# Altium project OpenRex_V1I1.PrjPcb (part 12 of 15)

## Sheet [23] - SENSORS, CAN, IR.SchDoc
size A2; DocumentNumber: 23; SheetNumber: 23; SheetTotal: 31
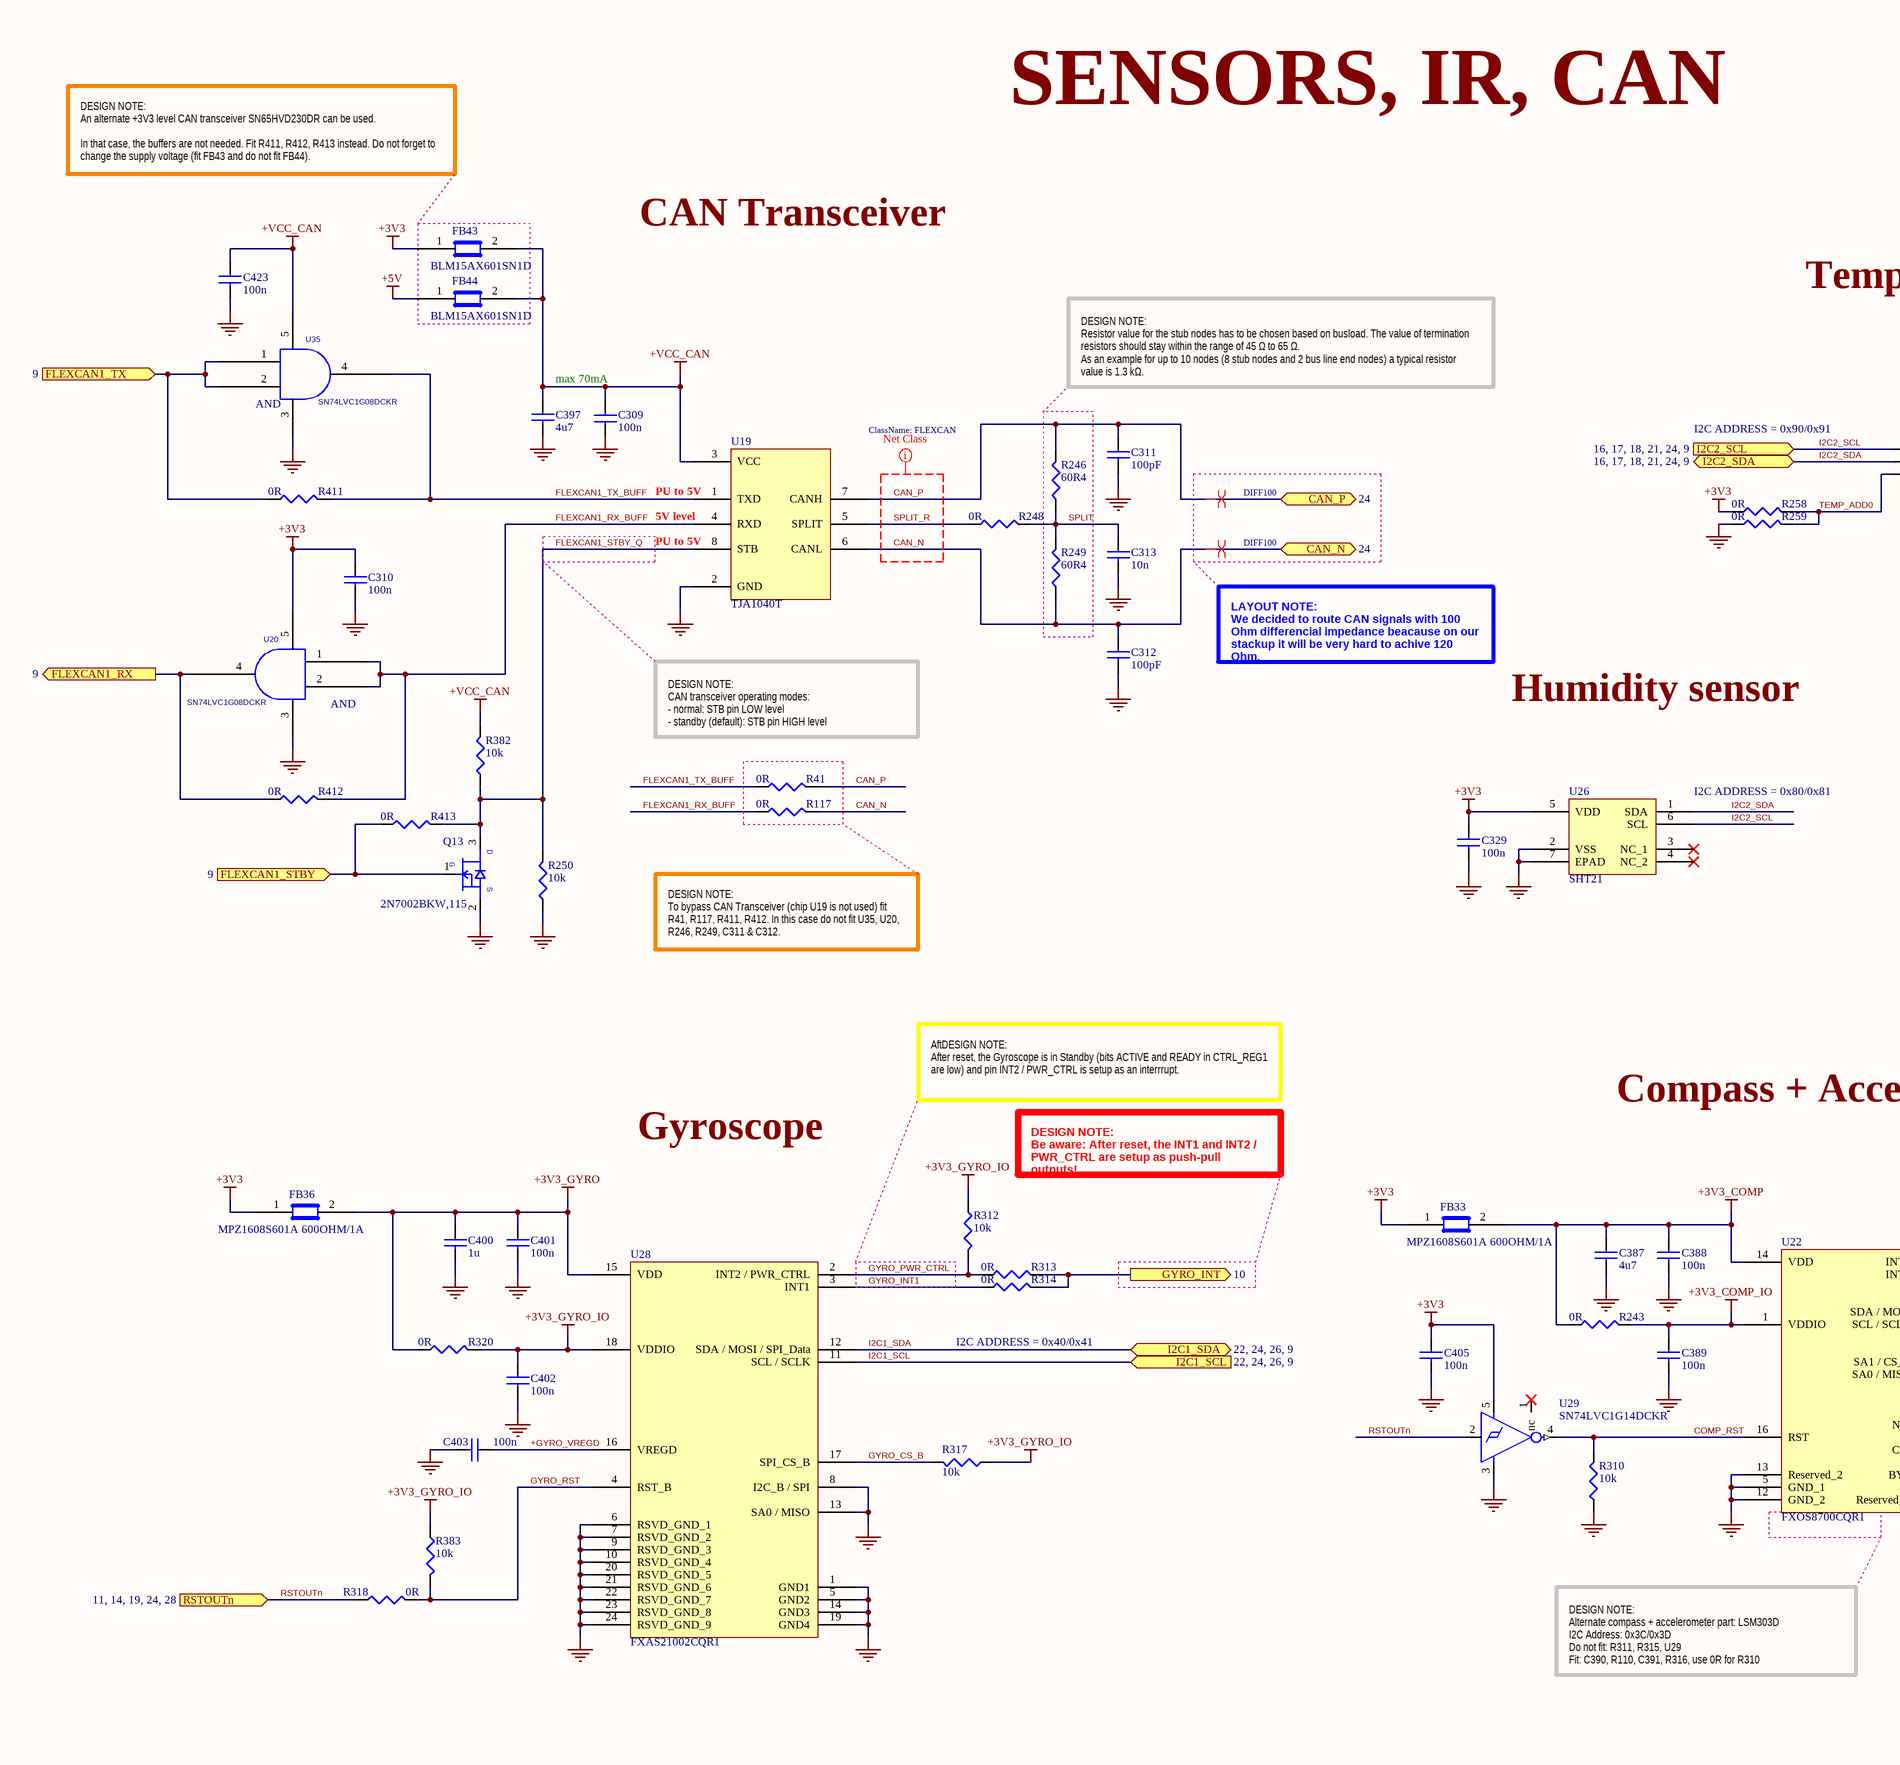
[diagram p44: [23] - SENSORS, CAN, IR.SchDoc, left]
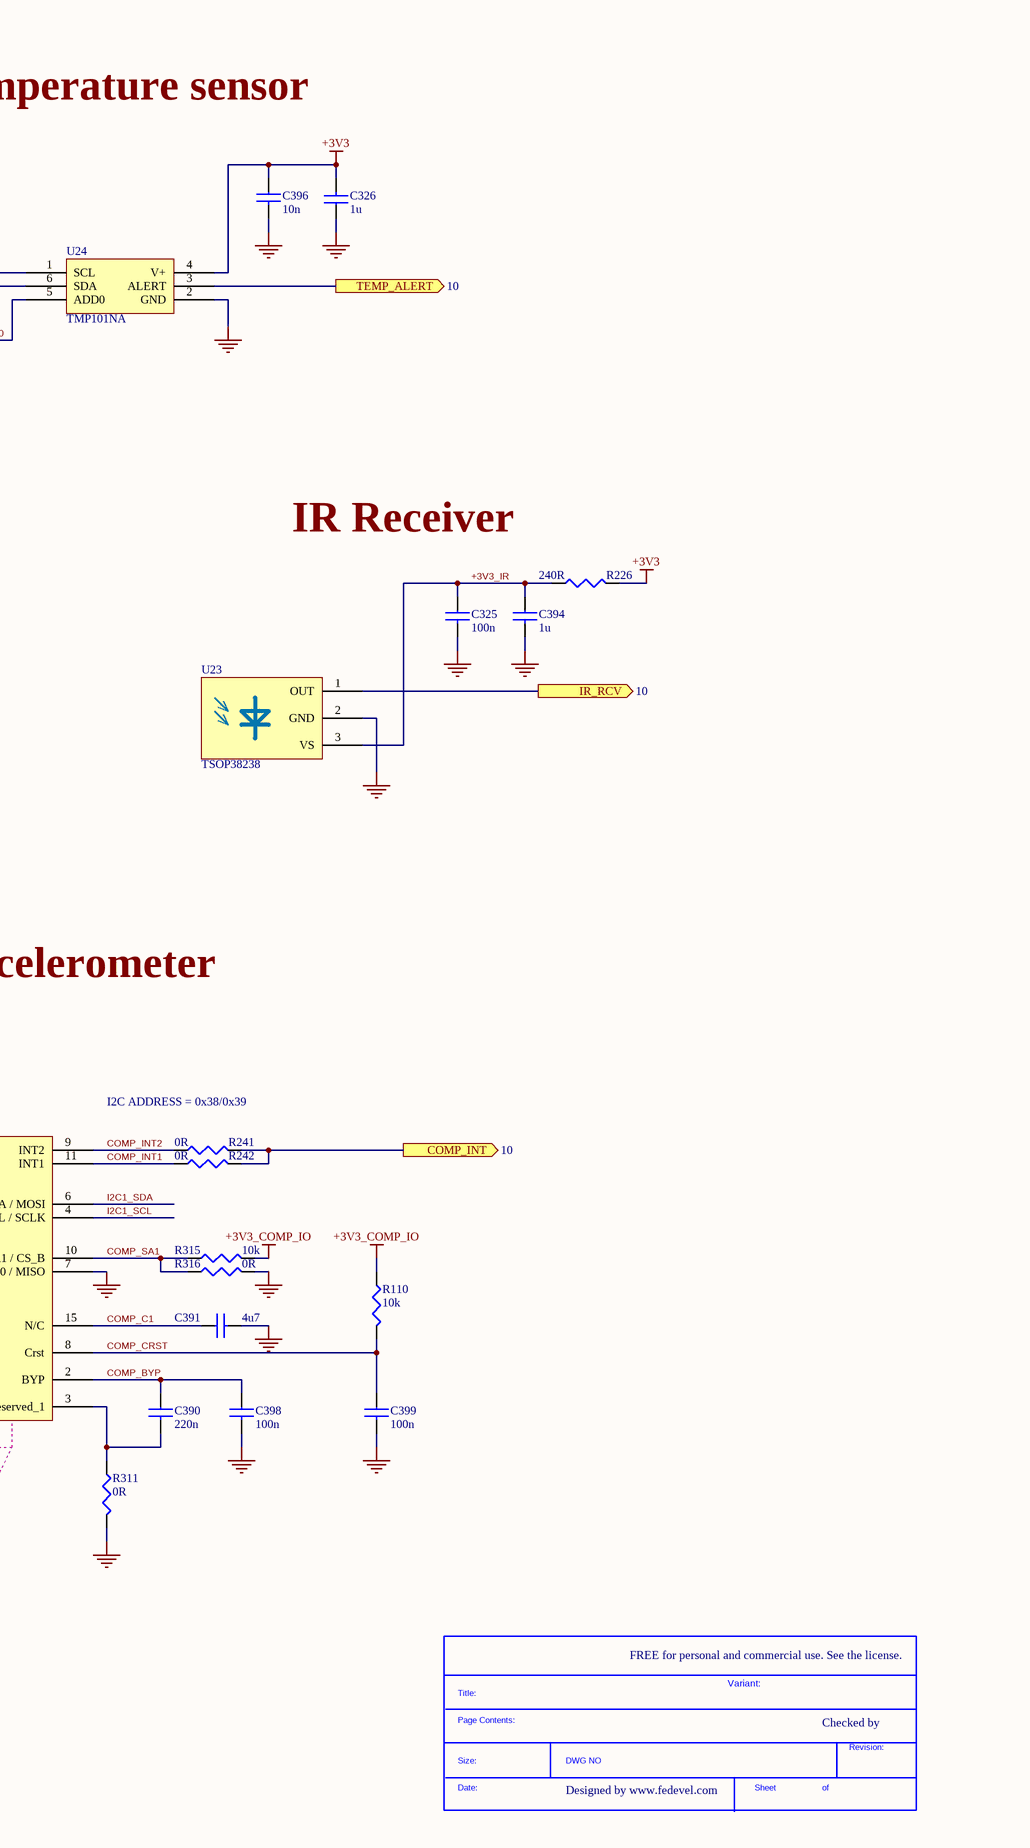
[diagram p45: [23] - SENSORS, CAN, IR.SchDoc, right]

### Parts
(Parts that share a designator on the sheet are numbered #1, #2 ... from top to bottom, then left to right.)
*#26  SDTitleBlock  (value not drawn)  (graphical)
C309  100n  [C0402]
C310  100n  [C0402]
C311  100pF  [C0402]
C312  100pF  [C0402]
C313  10n  [C0402]
C325  100n  [C0402]
C326  1u  [C0402]
C329  100n  [C0402]
C387  4u7  [C0402]
C388  100n  [C0402]
C389  100n  [C0402]
C390  220n  [C0402]
C391  4u7  [C0402]
C394  1u  [C0402]
C396  10n  [C0402]
C397  4u7  [C0402]
C398  100n  [C0402]
C399  100n  [C0402]
C400  1u  [C0402]
C401  100n  [C0402]
C402  100n  [C0402]
C403  100n  [C0402]
C405  100n  [C0402]
C423  100n  [C0402]
FB33  MPZ1608S601A 600OHM/1A  [C0603]
FB36  MPZ1608S601A 600OHM/1A  [C0603]
FB43  BLM15AX601SN1D  [C0402]
FB44  BLM15AX601SN1D  [C0402]
Q13  2N7002BKW,115  [SC70_SOT323]
R41  0R  [R0402]
R110  10k  [R0402]
R117  0R  [R0402]
R226  240R  [R0402]
R241  0R  [R0402]
R242  0R  [R0402]
R243  0R  [R0402]
R246  60R4  [R0402]
R248  0R  [R0402]
R249  60R4  [R0402]
R250  10k  [R0402]
R258  0R  [R0402]
R259  0R  [R0402]
R310  10k  [R0402]
R311  0R  [R0402]
R312  10k  [R0402]
R313  0R  [R0402]
R314  0R  [R0402]
R315  10k  [R0402]
R316  0R  [R0402]
R317  10k  [R0402]
R318  0R  [R0402]
R320  0R  [R0402]
R382  10k  [R0402]
R383  10k  [R0402]
R411  0R  [R0402]
R412  0R  [R0402]
R413  0R  [R0402]
U19  TJA1040T  [8_SOIC_3.9MM]
U20  SN74LVC1G08DCKR  [SC70_5]
U22  FXOS8700CQR1  [QFN16_3x3mm]
U23  TSOP38238  [TSOP382]
U24  TMP101NA  [SOT23-6_DBV6]
U26  SHT21  [6_DFN_3mmx3mm]
U28  FXAS21002CQR1  [QFN24_4x4MM]
U29  SN74LVC1G14DCKR  [SC70_5]
U35  SN74LVC1G08DCKR  [SC70_5]

### Ports
CAN_N (bidir, see 24), CAN_P (bidir, see 24), COMP_INT (out, see 10), FLEXCAN1_RX (out, see 9), FLEXCAN1_STBY (in, see 9), FLEXCAN1_TX (in, see 9), GYRO_INT (out, see 10), I2C1_SCL (see 22, 24, 26, 9), I2C1_SDA (bidir, see 22, 24, 26, 9), I2C2_SCL (see 16, 17, 18, 21, 24, 9), I2C2_SDA (bidir, see 16, 17, 18, 21, 24, 9), IR_RCV (out, see 10), RSTOUTn (see 11, 14, 19, 24, 28), TEMP_ALERT (out, see 10)

### Nets
+3V3: C310.1 C326.2 C329.1 C396.1 C405.1 FB33.1 FB36.1 FB43.1 R226.2 R258.1 U20.5(VCC) U24.4(V+) U26.5(VDD) U29.5(NC1)
+3V3_COMP: C387.1 C388.1 FB33.2 R243.1 U22.14(VDD)
+3V3_COMP_IO: C389.1 R110.1 R243.2 R315.2 U22.1(VDDIO)
+3V3_GYRO: C400.1 C401.1 FB36.2 R320.1 U28.15(VDD)
+3V3_GYRO_IO: C402.1 R312.1 R317.1 R320.2 R383.1 U28.18(VDDIO)
+5V: FB44.1
+VCC_CAN: C309.2 C397.1 C423.1 FB43.2 FB44.2 R382.2 U19.3(VCC) U35.5(VCC)
GND: C309.1 C310.2 C311.2 C312.2 C313.2 C325.2 C326.1 C329.2 C387.2 C388.2 C389.2 C391.2 C394.2 C396.2 C397.2 C398.2 C399.2 C400.2 C401.2 C402.2 C403.2 C405.2 C423.2 Q13.2(SOURCE) R250.1 R259.1 R310.1 R311.2 R316.2 U19.2(GND) U20.3(GND) U22.5(GND_1) U22.7(SA0_/_MISO) U22.12(GND_2) U22.13(Reserved_2) U23.2(GND) U24.2(GND) U26.2(VSS) U26.7(EPAD) U28.1(GND1) U28.5(GND2) U28.6(RSVD_GND_1) U28.7(RSVD_GND_2) U28.8(I2C_B_/_SPI) U28.9(RSVD_GND_3) U28.10(RSVD_GND_4) U28.13(SA0_/_MISO) U28.14(GND3) U28.19(GND4) U28.20(RSVD_GND_5) U28.21(RSVD_GND_6) U28.22(RSVD_GND_7) U28.23(RSVD_GND_8) U28.24(RSVD_GND_9) U29.3(GND) U35.3(GND)
+3V3_IR: C325.1 C394.1 R226.1 U23.3(VS)
+GYRO_VREGD: C403.1 U28.16(VREGD)
CAN_N: C312.1 R117.2 R249.1 U19.6(CANL) ; port CAN_N
CAN_P: C311.1 R41.2 R246.2 U19.7(CANH) ; port CAN_P
COMP_BYP: C390.1 C398.1 U22.2(BYP)
COMP_C1: C391.1 U22.15(N/C)
COMP_CRST: C399.1 R110.2 U22.8(Crst)
COMP_INT: R241.2 R242.2 ; port COMP_INT
COMP_INT1: R242.1 U22.11(INT1)
COMP_INT2: R241.1 U22.9(INT2)
COMP_RST: R310.2 U22.16(RST) U29.4(O)
COMP_SA1: R315.1 R316.1 U22.10(SA1_/_CS_B)
FLEXCAN1_RX: R412.1 U20.4(Y) ; port FLEXCAN1_RX
FLEXCAN1_RX_BUFF: R117.1 R412.2 U19.4(RXD) U20.1(A) U20.2(B)
FLEXCAN1_STBY: Q13.1(GATE) R413.1 ; port FLEXCAN1_STBY
FLEXCAN1_STBY_Q: Q13.3(DRAIN) R250.2 R382.1 R413.2 U19.8(STB)
FLEXCAN1_TX: R411.1 U35.1(A) U35.2(B) ; port FLEXCAN1_TX
FLEXCAN1_TX_BUFF: R41.1 R411.2 U19.1(TXD) U35.4(Y)
GYRO_CS_B: R317.2 U28.17(SPI_CS_B)
GYRO_INT: R313.2 R314.2 ; port GYRO_INT
GYRO_INT1: R314.1 U28.3(INT1)
GYRO_PWR_CTRL: R312.2 R313.1 U28.2(INT2_/_PWR_CTRL)
GYRO_RST: R318.2 R383.2 U28.4(RST_B)
I2C1_SCL: U22.4(SCL_/_SCLK) U28.11(SCL_/_SCLK) ; port I2C1_SCL
I2C1_SDA: U22.6(SDA_/_MOSI) U28.12(SDA_/_MOSI_/_SPI_Data) ; port I2C1_SDA
I2C2_SCL: U24.1(SCL) U26.6(SCL) ; port I2C2_SCL
I2C2_SDA: U24.6(SDA) U26.1(SDA) ; port I2C2_SDA
IR_RCV: U23.1(OUT) ; port IR_RCV
RSTOUTn: R318.1 U29.2(I) ; port RSTOUTn
SPLIT: C313.1 R246.1 R248.2 R249.2
SPLIT_R: R248.1 U19.5(SPLIT)
TEMP_ADD0: R258.2 R259.2 U24.5(ADD0)
TEMP_ALERT: U24.3(ALERT) ; port TEMP_ALERT
NetC390_2: C390.2 R311.1 U22.3(Reserved_1)

Not connected (* = marked no-connect by the designer): U26 3(NC_1)* 4(NC_2)*; U29 1(nc)*

### Layout directives
net class FLEXCAN: CAN_N, CAN_P, SPLIT_R
differential pair; net class DIFF100: CAN_N, CAN_P

### Notes on the sheet
- SENSORS, IR, CAN
- DESIGN NOTE:
  An alternate +3V3 level CAN transceiver SN65HVD230DR can be used.
  In that case, the buffers are not needed. Fit R411, R412, R413 instead. Do not forget to change the supply voltage (fit FB43 and do not fit FB44).
- CAN Transceiver
- Temperature sensor
- max 70mA
- DESIGN NOTE:
  Resistor value for the stub nodes has to be chosen based on busload. The value of termination resistors should stay within the range of 45 Ω to 65 Ω.
  As an example for up to 10 nodes (8 stub nodes and 2 bus line end nodes) a typical resistor value is 1.3 kΩ.
- I2C ADDRESS = 0x90/0x91
- (near U19) PU to 5V
- (near U19) 5V level
- LAYOUT NOTE:
  We decided to route CAN signals with 100 Ohm differencial impedance beacause on our stackup it will be very hard to achive 120 Ohm.
- DESIGN NOTE:
  CAN transceiver operating modes:
  - normal: STB pin LOW level
  - standby (default): STB pin HIGH level
- Humidity sensor
- IR Receiver
- (near U26) I2C ADDRESS = 0x80/0x81
- DESIGN NOTE:
  To bypass CAN Transceiver (chip U19 is not used) fit R41, R117, R411, R412. In this case do not fit U35, U20, R246, R249, C311 & C312.
- AftDESIGN NOTE:
  After reset, the Gyroscope is in Standby (bits ACTIVE and READY in CTRL_REG1 are low) and pin INT2 / PWR_CTRL is setup as an interrrupt.
- Compass + Accelerometer
- Gyroscope
- DESIGN NOTE:
  Be aware: After reset, the INT1 and INT2 / PWR_CTRL are setup as push-pull outputs!
- I2C ADDRESS = 0x38/0x39
- I2C ADDRESS = 0x40/0x41
- DESIGN NOTE:
  Alternate compass + accelerometer part: LSM303D
  I2C Address: 0x3C/0x3D
  Do not fit: R311, R315, U29
  Fit: C390, R110, C391, R316, use 0R for R310
- FREE for personal and commercial use. See the license.
- Variant:
- Checked by
- Designed by www.fedevel.com
- (in symbol 2N7002BKW,115) D; G; S
- (in symbol SDTitleBlock) Title:; Page Contents:; Revision:; Size:; DWG NO; Date:; Sheet; of
- (in symbol SN74LVC1G08DCKR) AND

### Library data of the parts
C309 C310 C325 C329 C388 C389 C398 C399 C401-C403 C405 C423 = C1005X5R1H104K: as C230 on sheet [28] - PWR IN, MECH, DOC; Category: Capacitors; Supplier Part Number: 445-5942-1-ND; Manufacturer Part Number: C1005X5R1H104K; Operating Temperature: -55°C ~ 85°C; Package / Case: 0402 (1005 Metric); Price 1k [$]: 0.02340; .Checked SCH: used; Voltage - Rated: 50V; Supplier: Digikey; Supplier 1: Digi-Key; Supplier Part Number 1: 445-5942-1-ND; RoHS: RoHS Compliant; Stock 1: 106926; Pricing 1: 1=0.27, 10=0.18, 100=0.072, 250=0.05176, 500=0.0369, 1000=0.027 (USD); Tolerance: ±10%; Temperature Coefficient: X5R; Mounting Type: Surface Mount, MLCC; Applications: General Purpose; Ratings: -; Size / Dimension: 0.039" L x 0.020" W (1.00mm x 0.50mm); Height - Seated (Max): -; Thickness (Max): 0.022" (0.55mm); Lead Spacing: -; Features: -; Packaging: Cut Tape (CT); Lead Style: -; ComponentLink1URL: http://www.tdk.co.jp/tefe02/e412_c.pdf; ComponentLink1Description: http://www.tdk.co.jp/tefe02/e412_c.pdf
C311 C312 = C1005C0G1H101J: CAP CER 100PF 50V 5% NP0 0402; Manufacturer: TDK Corporation; Temperature Coefficient: C0G, NP0; .Checked PCB: used; Supplier 1: Digi-Key; Supplier Part Number 1: 445-1247-1-ND; Manufacturer Part Number: C1005C0G1H101J; RoHS: RoHS Compliant; Category: Capacitors; Stock 1: 298233; Pricing 1: 1=0.08, 10=0.05, 100=0.018, 250=0.013, 500=0.0096, 1000=0.0065 (USD); Capacitance: 100pF; Voltage - Rated: 50V; Tolerance: ±5%; Mounting Type: Surface Mount, MLCC; Operating Temperature: -55°C ~ 125°C; Applications: General Purpose; Ratings: -; Package / Case: 0402 (1005 Metric); Size / Dimension: 0.039" L x 0.020" W (1.00mm x 0.50mm); Height - Seated (Max): -; Thickness (Max): 0.022" (0.55mm); Lead Spacing: -; Features: -; Packaging: Cut Tape (CT); Lead Style: -; ComponentLink1URL: http://www.tdk.com/pdf/general_B11.pdf; ComponentLink1Description: http://www.tdk.com/pdf/general_B11.pdf; .Checked SCH: used
C313 C396 = C1005X7R1H103K: CAP CER 10000PF 50V 10% X7R 0402; Manufacturer: TDK Corporation; Value: 10nF; .Checked PCB: used; Capacitance: 10000pF; Category: Capacitors; Supplier Part Number: 445-6850-1-ND; Manufacturer Part Number: C1005X7R1H103K; Operating Temperature: -55°C ~ 125°C; Package / Case: 0402 (1005 Metric); Price 1k [$]: 0.01625; .Checked SCH: used; Voltage - Rated: 50V; Supplier: Digikey; Supplier 1: Digi-Key; Supplier Part Number 1: 445-6850-1-ND; RoHS: RoHS Compliant; Stock 1: 3901; Pricing 1: 1=0.2, 10=0.125, 100=0.045, 250=0.03252, 500=0.024, 1000=0.01625 (USD); Tolerance: ±10%; Temperature Coefficient: X7R; Mounting Type: Surface Mount, MLCC; Applications: General Purpose; Ratings: -; Size / Dimension: 0.039" L x 0.020" W (1.00mm x 0.50mm); Height - Seated (Max): -; Thickness (Max): 0.022" (0.55mm); Lead Spacing: -; Features: -; Packaging: Cut Tape (CT); Lead Style: -; ComponentLink1URL: http://www.tdk.co.jp/tefe02/e412_c.pdf; ComponentLink1Description: http://www.tdk.co.jp/tefe02/e412_c.pdf
C326 C394 C400 = C1005X5R1C105K: CAP CER 1.0UF 16V X5R 0402; Manufacturer: TDK Corporation; Capacitance: 1.0µF; Value: 1uF; .Checked PCB: used; Tolerance: ±10%; Category: Capacitors; Supplier Part Number: 445-4978-1-ND; Manufacturer Part Number: C1005X5R1C105K; Operating Temperature: -55°C ~ 85°C; Package / Case: 0402 (1005 Metric); Price 1k [$]: 0.02080; .Checked SCH: used; Voltage - Rated: 16V; Supplier: Digikey; Supplier 1: Digi-Key; Supplier Part Number 1: 445-4978-1-ND; RoHS: RoHS Compliant; Stock 1: 341010; Pricing 1: 1=0.24, 10=0.16, 100=0.064, 250=0.046, 500=0.0328, 1000=0.024 (USD); Temperature Coefficient: X5R; Mounting Type: Surface Mount, MLCC; Applications: General Purpose; Ratings: -; Size / Dimension: 0.039" L x 0.020" W (1.00mm x 0.50mm); Height - Seated (Max): -; Thickness (Max): 0.022" (0.55mm); Lead Spacing: -; Features: -; Packaging: Cut Tape (CT); Lead Style: -; ComponentLink1URL: http://www.tdk.co.jp/tefe02/e412_c.pdf; ComponentLink1Description: http://www.tdk.co.jp/tefe02/e412_c.pdf
C387 C391 C397 = C1005X5R1A475M: CAP CER 4.7UF 10V 20% X5R 0402; Manufacturer: TDK Corporation; Capacitance: 4.7µF; .Checked PCB: used; Supplier 1: Digi-Key; Supplier Part Number 1: 445-8023-1-ND; Manufacturer Part Number: C1005X5R1A475M; RoHS: RoHS Compliant; Category: Capacitors; Stock 1: 10140; Pricing 1: 1=0.53, 10=0.415, 100=0.25, 250=0.18752, 500=0.16, 1000=0.125, 5000=0.095 (USD); Voltage - Rated: 10V; Tolerance: ±20%; Temperature Coefficient: X5R; Mounting Type: Surface Mount, MLCC; Operating Temperature: -55°C ~ 85°C; Applications: General Purpose; Ratings: -; Package / Case: 0402 (1005 Metric); Size / Dimension: 0.039" L x 0.020" W (1.00mm x 0.50mm); Height - Seated (Max): -; Thickness (Max): -; Lead Spacing: -; Features: -; Packaging: Cut Tape (CT); Lead Style: -; ComponentLink1URL: http://www.tdk.com/pdf/general_B11.pdf; ComponentLink1Description: http://www.tdk.com/pdf/general_B11.pdf; .Checked SCH: used
C390 = C1005X5R1E224M: CAP CER .22UF 25V X5R 20% 0402; Manufacturer: TDK Corporation; Capacitance: 0.22µF; Value: 220nF; .Checked PCB: used; Category: Capacitors; Supplier Part Number: 445-5945-1-ND; Manufacturer Part Number: C1005X5R1E224M; Operating Temperature: -55°C ~ 85°C; Package / Case: 0402 (1005 Metric); Price 1k [$]: 0.02600; .Checked SCH: used; Voltage - Rated: 25V; Supplier: Digikey; Supplier 1: Digi-Key; Supplier Part Number 1: 445-5945-1-ND; RoHS: RoHS Compliant; Stock 1: 54593; Pricing 1: 1=0.3, 10=0.2, 100=0.08, 250=0.05752, 500=0.041, 1000=0.03 (USD); Tolerance: ±20%; Temperature Coefficient: X5R; Mounting Type: Surface Mount, MLCC; Applications: General Purpose; Ratings: -; Size / Dimension: 0.039" L x 0.020" W (1.00mm x 0.50mm); Height - Seated (Max): -; Thickness (Max): 0.022" (0.55mm); Lead Spacing: -; Features: -; Packaging: Cut Tape (CT); Lead Style: -; ComponentLink1URL: http://www.tdk.co.jp/tefe02/e412_c.pdf; ComponentLink1Description: http://www.tdk.co.jp/tefe02/e412_c.pdf
FB33 FB36 = MPZ1608S601A: FERRITE CHIP BEAD 600 OHM SMD 1A; Manufacturer: TDK Corporation; Impedance @ Frequency: 600 Ohm @ 100MHz; DC Resistance (DCR): 150 mOhm Max; Filter Type: Differential Mode - Single; Number of Lines: 1; .Checked PCB: used; Supplier 1: Digi-Key; Supplier Part Number 1: 445-2205-1-ND; Manufacturer Part Number: MPZ1608S601A; RoHS: RoHS Compliant; Category: Filters; Stock 1: 328345; Pricing 1: 1=0.36, 10=0.24, 100=0.096, 250=0.069, 500=0.0492, 1000=0.036 (USD); Current Rating: 1A; Package / Case: 0603 (1608 Metric); Mounting Type: Surface Mount; Packaging: Cut Tape (CT); Height (Max): 0.037" (0.95mm); Size / Dimension: 0.063" L x 0.031" W (1.60mm x 0.80mm); ComponentLink1URL: http://www.tdk.co.jp/tefe02/e9413_mpz.pdf; ComponentLink1Description: http://www.tdk.co.jp/tefe02/e9413_mpz.pdf; .Checked SCH: used
FB43 FB44 = BLM15AX601SN1D: FERRITE CHIP 600 OHM 0402 420mA; Manufacturer: Murata Electronics North America; .Checked PCB: used; Impedance @ Frequency: 600 Ohm @ 100MHz; DC Resistance (DCR): 340 mOhm Max; Filter Type: Differential Mode - Single; Number of Lines: 1; .Checked SCH: used; Category: Filters; Supplier Part Number: 490-5441-1-ND; Manufacturer Part Number: BLM15AX601SN1D; Package / Case: 0402 (1005 Metric); Price 1k [$]: 0.03280; Value: BLM15AX601SN1D; Current Rating: 420mA; Supplier: Digikey; Supplier 1: Digi-Key; Supplier Part Number 1: 490-5441-1-ND; RoHS: RoHS Compliant; Stock 1: 34008; Pricing 1: 1=0.26, 10=0.197, 50=0.1148, 100=0.0918, 250=0.0656, 500=0.0446, 1000=0.03608, 5000=0.02821 (USD); Mounting Type: Surface Mount; Packaging: Cut Tape (CT); Height (Max): 0.022" (0.55mm); Size / Dimension: 0.039" L x 0.020" W (1.00mm x 0.50mm); ComponentLink1URL: http://search.murata.co.jp/Ceramy/image/img/PDF/ENG/L0110S0100BLM15AX_SN.pdf; ComponentLink1Description: http://search.murata.co.jp/Ceramy/image/img/PDF/ENG/L0110S0100BLM15AX_SN.pdf
Q13 = 2N7002BKW,115: as Q3 on sheet [22] - SD CARD, SPI, FLASH, EEPROM,; Supplier 1: Digi-Key; Supplier Part Number 1: 568-5980-1-ND; Manufacturer Part Number: 2N7002BKW,115; RoHS: RoHS Compliant; Category: Discrete Semiconductor Products; Stock 1: 15666; Pricing 1: 1=0.39, 10=0.354, 25=0.2548, 100=0.1983, 250=0.12456, 500=0.10616, 1000=0.07233 (USD); Drain to Source Voltage (Vdss): 60V; Current - Continuous Drain (Id) @ 25° C: 310mA; Mounting Type: Surface Mount; Package / Case: SC-70, SOT-323; Supplier Device Package: SC-70; Packaging: Cut Tape (CT); ComponentLink1URL: http://www.nxp.com/documents/data_sheet/2N7002BKW.pdf; ComponentLink1Description: http://www.nxp.com/documents/data_sheet/2N7002BKW.pdf; .Checked SCH: used
R41 R117 R241-R243 R248 R258 R259 R311 R313 R314 R316 R318 R320 R411-R413 = RC0402JR-070RL: as R155 on sheet [28] - PWR IN, MECH, DOC; Category: Resistors; Supplier Part Number: 311-0.0JRCT-ND; Manufacturer Part Number: RC0402JR-070RL; Package / Case: 0402 (1005 Metric); Price 1k [$]: 0.01389; Value: 0R; .Checked SCH: used; Supplier: Digikey; Supplier 1: Digi-Key; Supplier Part Number 1: 311-0.0JRCT-ND; RoHS: RoHS Compliant; Stock 1: 1106330; Pricing 1: 10=0.012, 50=0.009, 100=0.0069, 250=0.00512, 500=0.0038, 1000=0.00253 (USD); Composition: Thick Film; Features: -; Temperature Coefficient: -; Size / Dimension: 0.039" L x 0.020" W (1.00mm x 0.50mm); Height: 0.016" (0.40mm); Number of Terminations: 2; Packaging: Cut Tape (CT); ComponentLink1URL: http://www.yageo.com/documents/recent/PYu-RC0402_51_RoHS_L_6.pdf; ComponentLink1Description: http://www.yageo.com/documents/recent/PYu-RC0402_51_RoHS_L_6.pdf
R110 R250 R310 R312 R315 R317 R382 R383 = RC0402FR-0710KL: as R174 on sheet [28] - PWR IN, MECH, DOC; Category: Resistors; Manufacturer Part Number: RC0402FR-0710KL; Package / Case: 0402 (1005 Metric); Price 1k [$]: 0.01421; Resistance (Ohms): 10K; Tolerance: ±1%; Value: 10k; .Checked SCH: used; Supplier Part Number: 311-10.0KLRCT-ND; Supplier: Digikey; Supplier 1: Digi-Key; Supplier Part Number 1: 311-10.0KLRCT-ND; RoHS: RoHS Compliant; Stock 1: 2916495; Pricing 1: 10=0.014, 50=0.0104, 100=0.0079, 250=0.00584, 500=0.00432, 1000=0.00288 (USD); Composition: Thick Film; Features: -; Size / Dimension: 0.039" L x 0.020" W (1.00mm x 0.50mm); Height: 0.016" (0.40mm); Number of Terminations: 2; Packaging: Cut Tape (CT); ComponentLink1URL: http://www.yageo.com/documents/recent/PYu-RC0402_51_RoHS_L_6.pdf; ComponentLink1Description: http://www.yageo.com/documents/recent/PYu-RC0402_51_RoHS_L_6.pdf
R226 = RMCF0402FT240R: as R185 on sheet [22] - SD CARD, SPI, FLASH, EEPROM,; Category: Resistors; Supplier Part Number: RMCF0402FT240RCT-ND; Manufacturer Part Number: RMCF0402FT240R; Package / Case: 0402 (1005 Metric); Price 1k [$]: 0.00384; Tolerance: ±1%; Value: 240R; .Checked SCH: used; Supplier: Digikey; Supplier 1: Digi-Key; Supplier Part Number 1: RMCF0402FT240RCT-ND; RoHS: RoHS Compliant; Stock 1: 39860; Pricing 1: 1=0.04, 10=0.025, 50=0.0138, 100=0.0105, 250=0.0078, 500=0.00576, 1000=0.00384 (USD); Composition: Thick Film; Features: -; Size / Dimension: 0.039" L x 0.020" W (1.00mm x 0.50mm); Height: 0.016" (0.40mm); Number of Terminations: 2; Packaging: Cut Tape (CT); ComponentLink1URL: http://www.seielect.com/Catalog/SEI-RMCF.pdf; ComponentLink1Description: http://www.seielect.com/Catalog/SEI-RMCF.pdf
R246 R249 = RC0402FR-0760R4L: RES SMD 60.4 OHM 1% 1/16W 0402; Manufacturer: Yageo; Resistance (Ohms): 60.4; Power (Watts): 0.063W, 1/16W; Temperature Coefficient: ±100ppm/°C; .Creator: MM; Supplier 1: Digi-Key; Manufacturer Part Number: RC0402FR-0760R4L; RoHS: RoHS Compliant; Category: Resistors; Stock 1: 33933; Pricing 1: 1=0.1, 10=0.015, 25=0.0108, 100=0.006, 250=0.00456, 500=0.00364, 1000=0.00268, 2500=0.00233, 5000=0.00192 (USD); Packaging: Cut Tape (CT); Tolerance: ±1%; Composition: Thick Film; Features: Moisture Resistant; Operating Temperature: -55°C ~ 155°C; Package / Case: 0402 (1005 Metric); Supplier Device Package: 0402; Size / Dimension: 0.039" L x 0.020" W (1.00mm x 0.50mm); Height: 0.016" (0.40mm); Number of Terminations: 2; ComponentLink1URL: http://www.yageo.com/NewPortal/yageodocoutput?fileName=/pdf/R-Chip/PYu-RC_Group_51_RoHS_L_0.pdf; ComponentLink1Description: http://www.yageo.com/NewPortal/yageodocoutput?fileName=/pdf/R-Chip/PYu-RC_Group_51_RoHS_L_0.pdf; Supplier Part Number 1: 311-60.4LRCT-ND; .Checked PCB: MM; .Checked SCH: MM
U19 = TJA1040T/CM,118: IC TRANSCEIVER CAN 8SOIC; Manufacturer: NXP Semiconductors; Number of Drivers/Receivers: 1/1; Duplex: Half; Receiver Hysteresis: 70mV; Voltage - Supply: 4.75 V ~ 5.25 V; .Creator: MM; Supplier 1: Digi-Key; Manufacturer Part Number: TJA1040T/CM,118; RoHS: RoHS Compliant; Category: Integrated Circuits (ICs); Stock 1: 2927; Pricing 1: 1=1.32, 10=1.169, 25=1.0552, 100=0.9233, 250=0.80976, 500=0.71814, 1000=0.56792 (USD); Packaging: Cut Tape (CT); Type: Transceiver; Protocol: CAN; Data Rate: -; Operating Temperature: -; Mounting Type: Surface Mount; Package / Case: 8-SOIC (0.154", 3.90mm Width); Supplier Device Package: 8-SO; ComponentLink1URL: http://www.nxp.com/documents/data_sheet/TJA1040.pdf; ComponentLink1Description: http://www.nxp.com/documents/data_sheet/TJA1040.pdf; Supplier Part Number 1: 568-10289-1-ND; .Checked PCB: MM; .Checked SCH: MM
U20 U35 = SN74LVC1G08DCKR: SINGLE POSITIVE AND GATE SC-70; Manufacturer: Texas Instruments; .Checked PCB: used; Number of Inputs: 2; Voltage - Supply: 1.65 V ~ 5.5 V; Number of Circuits: 1; Current - Output High, Low: 32mA, 32mA; .Checked SCH: used; Category: Integrated Circuits (ICs); Supplier Part Number: 296-11602-1-ND; Family: Logic - Gates and Inverters; Manufacturer Part Number: SN74LVC1G08DCKR; Operating Temperature: -40°C ~ 85°C; Package / Case: 6-TSSOP (5 lead), SC-88A, SOT-353; Price 1k [$]: 0.11250; Value: SN74LVC1G08DCKR; Logic Type: AND Gate; Supplier: Digikey; Supplier 1: Digi-Key; Supplier Part Number 1: 296-11602-1-ND; RoHS: RoHS Compliant; Stock 1: 36212; Pricing 1: 1=0.7, 25=0.322, 100=0.224, 250=0.1596, 500=0.1218, 1000=0.084 (USD); Mounting Type: Surface Mount; Supplier Device Package: SC-70-5; Packaging: Cut Tape (CT); ComponentLink1URL: http://www.ti.com/lit/ds/symlink/sn74lvc1g08.pdf; ComponentLink1Description: http://www.ti.com/lit/ds/symlink/sn74lvc1g08.pdf
U22 = FXOS8700CQR1: SENSOR XTRINSIC 6-AXIS QFN; Manufacturer: Freescale Semiconductor; Sensor Type: Accelerometer, Magnetometer, 3 Axis; Output Type: I²C, SPI; .Checked PCB: MM; Supplier 1: Digi-Key; Manufacturer Part Number: FXOS8700CQR1; RoHS: RoHS Compliant; Category: Sensors, Transducers; Stock 1: 6201; Pricing 1: 1=2.63, 10=2.35, 25=2.2092, 100=2.115, 250=2.021, 500=1.88 (USD); ComponentLink1URL: http://cache.freescale.com/files/sensors/doc/data_sheet/FXOS8700CQ.pdf; ComponentLink1Description: http://cache.freescale.com/files/sensors/doc/data_sheet/FXOS8700CQ.pdf; Supplier Part Number 1: FXOS8700CQR1CT-ND; .Checked SCH: MM; .Creator: MM
U23 = TSOP38238: IC IR RCVR MOD 38KHZ DOME AXIAL; Manufacturer: Vishay Semiconductor Opto Division; Sensing Distance: 45m; B.P.F. Center Frequency: 38.0kHz; Voltage - Supply: 2.5 V ~ 5.5 V; Current - Supply: 450µA; .Creator: MM; Supplier 1: Digi-Key; Manufacturer Part Number: TSOP38238; RoHS: RoHS Compliant; Category: Sensors, Transducers; Stock 1: 4083; Pricing 1: 1=1.12, 10=0.878, 25=0.756, 50=0.6548, 100=0.594, 250=0.54, 500=0.4995, 1000=0.4455, 2500=0.432 (USD); Orientation: Side View; Mounting Type: Through Hole; ComponentLink1URL: http://www.vishay.com/docs/82491/tsop382.pdf; ComponentLink1Description: http://www.vishay.com/docs/82491/tsop382.pdf; Supplier Part Number 1: 751-1227-ND; .Checked PCB: MM; .Checked SCH: MM
U24 = TMP101NA: IC DIGITAL TEMP SENSOR SOT23-6; Manufacturer: Texas Instruments; Manufacturer Part Number: TMP101NA/3K; Function: Temp Monitoring System (Sensor); Sensor Type: Internal; Sensing Temperature: -55°C ~ 125°C; Accuracy: ±3°C(Max); Topology: ADC (Sigma Delta), Register Bank; Output Type: I²C™/SMBus™; Output Alarm: Yes; Output Fan: No; Voltage - Supply: 2.7 V ~ 5.5 V; .Checked PCB: RF(LibOnly), MM; .Checked SCH: RF; Supplier 1: Digi-Key; Supplier Part Number 1: 296-27725-1-ND; RoHS: RoHS Compliant; Category: Integrated Circuits (ICs); Stock 1: 3233; Pricing 1: 1=2.55, 10=2.304, 25=2.064, 100=1.856, 250=1.648, 500=1.44, 1000=1.192 (USD); Operating Temperature: -55°C ~ 125°C; Mounting Type: Surface Mount; Package / Case: SOT-23-6; Supplier Device Package: SOT-23-6; Packaging: Cut Tape (CT); ComponentLink1URL: http://www.ti.com/lit/ds/symlink/tmp100.pdf; ComponentLink1Description: http://www.ti.com/lit/ds/symlink/tmp100.pdf
U26 = SHT21: SENSIRION - SHT21 - SENSOR, HUMIDITY & TEMP, 3X3MM, 2%; Humidity Range: 0% to 100; Sensitivity: ± 1%; Sensor Output1: Digital; Sensor Terminals: SMD; Response Time: 5; Supply Voltage Min: 2.1; Supply Voltage Max: 3.6; .Creator: MM; Supplier 1: Farnell; Manufacturer: SENSIRION; Manufacturer Part Number: SHT21; RoHS: YES; Stock 1: 8509; Pricing 1: 1=3.03, 10=2.94, 25=2.88, 50=2.75, 100=2.55 (GBP); Sensing Accuracy: 2%; Capacitance: -; Operating Temperature Min: -40; Operating Temperature Max: 125; MSL: MSL 1 - Unlimited<!--FANDB--><div class="features-and-benefits-container"></div>; ComponentLink1URL: http://www.farnell.com/datasheets/1780639.pdf; ComponentLink1Description: http://www.farnell.com/datasheets/1780639.pdf; ComponentLink2URL: http://www.farnell.com/cad/1670197.zip; ComponentLink2Description: http://www.farnell.com/cad/1670197.zip; Supplier Part Number 1: 1855468; Category: Integrated Circuits (ICs); .Checked PCB: MM; .Checked SCH: MM
U28 = FXAS21002CQR1: GYROSCOPE 3-AXIS 24QFN; Manufacturer: Freescale Semiconductor; Range °/s: ±250°/s, ±500°/s, ±1000°/s, ±2000°/s; Sensitivity: 0.0078°/s/LSB, 0.0156°/s/LSB, 0.0312°/s/LSB, 0.0625°/s/LSB; Typical Bandwidth: 400Hz; Voltage - Supply: 1.95 V ~ 3.6 V; Current - Supply: 2.7mA; Output Type: I²C, SPI; .Checked PCB: MM; Supplier 1: Digi-Key; Manufacturer Part Number: FXAS21002CQR1; RoHS: RoHS Compliant; Category: Sensors, Transducers; Stock 1: 1703; Pricing 1: 1=3.56, 10=3.175, 25=2.9844, 100=2.8575, 250=2.73052, 500=2.54 (USD); Operating Temperature: -40°C ~ 85°C; Package / Case: 24-TFQFN Exposed Pad; Supplier Device Package: 24-QFN (4x4); ComponentLink1URL: http://cache.freescale.com/files/sensors/doc/data_sheet/FXAS21002.pdf; ComponentLink1Description: http://cache.freescale.com/files/sensors/doc/data_sheet/FXAS21002.pdf; Supplier Part Number 1: FXAS21002CQR1CT-ND; .Checked SCH: MM; .Creator: MM
U29 = SN74LVC1G14DCKR: IC SGL SCHMT-TRIG INVERT SC70-5; Manufacturer: Texas Instruments; Logic Type: Inverter; Number of Circuits: 1; Voltage - Supply: 1.65 V ~ 5.5 V; Current - Quiescent (Max): 10µA; Current - Output High, Low: 32mA, 32mA; Logic Level - Low: 0.39 V ~ 1.87 V; Logic Level - High: 1.16 V ~ 3.33 V; Max Propagation Delay @ V, Max CL: 5ns @ 5V, 50pF; .Checked PCB: MM, paper model not checked; .Checked SCH: MM; Supplier 1: Digi-Key; Manufacturer Part Number: SN74LVC1G14DCKR; RoHS: RoHS Compliant; Category: Integrated Circuits (ICs); Stock 1: 49135; Pricing 1: 1=0.49, 10=0.284, 100=0.134, 1000=0.103 (USD); Packaging: Cut Tape (CT); Number of Inputs: 1; Features: Schmitt Trigger; Operating Temperature: -40°C ~ 85°C; Mounting Type: Surface Mount; Supplier Device Package: SC-70-5; Package / Case: 5-TSSOP, SC-70-5, SOT-353; ComponentLink1URL: http://www.ti.com/lit/ds/symlink/sn74lvc1g14.pdf; ComponentLink1Description: http://www.ti.com/lit/ds/symlink/sn74lvc1g14.pdf; Supplier Part Number 1: 296-11608-1-ND; .Creator: MM

## Sheet [30] - REVISION HISTORY.SchDoc
size A3; DocumentNumber: 30; SheetNumber: 30; SheetTotal: 31
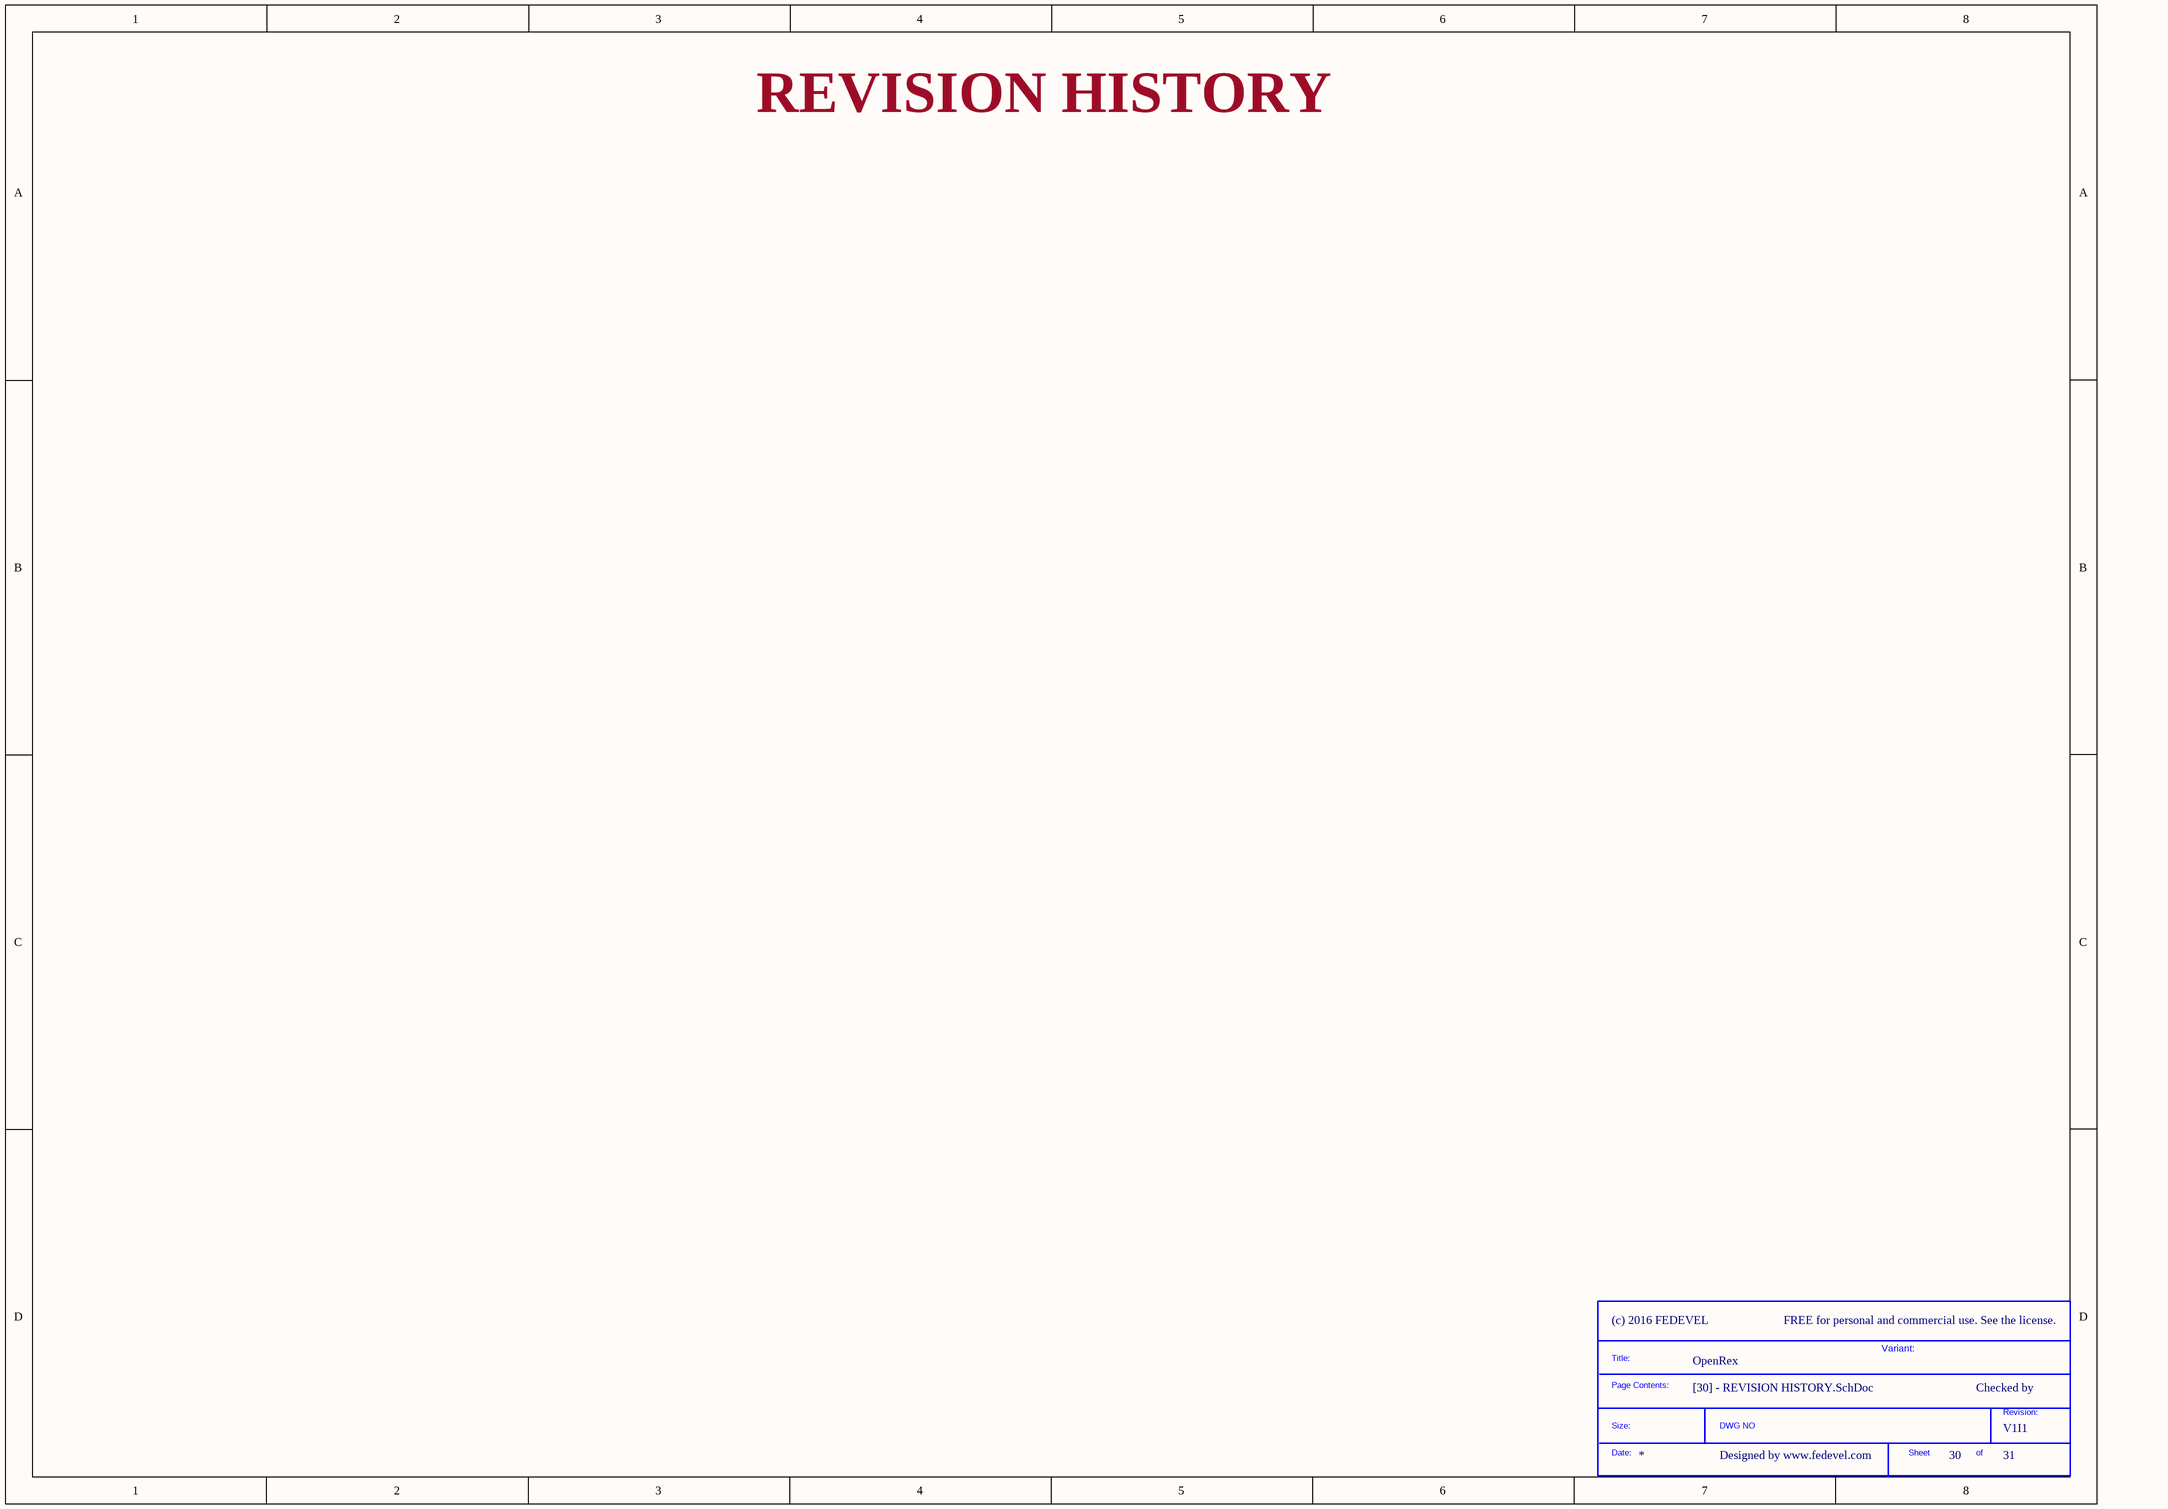
[diagram p46: [30] - REVISION HISTORY.SchDoc]

### Parts
(Parts that share a designator on the sheet are numbered #1, #2 ... from top to bottom, then left to right.)
*#27  SDTitleBlock  (value not drawn)  (graphical)

### Notes on the sheet
- REVISION HISTORY
- FREE for personal and commercial use. See the license.
- Variant:
- Checked by
- Designed by www.fedevel.com
- (in symbol SDTitleBlock) Title:; Page Contents:; Revision:; Size:; DWG NO; Date:; Sheet; of

## Sheet [16] - HDMI.SchDoc
size A3; DocumentNumber: 16; SheetNumber: 16; SheetTotal: 31
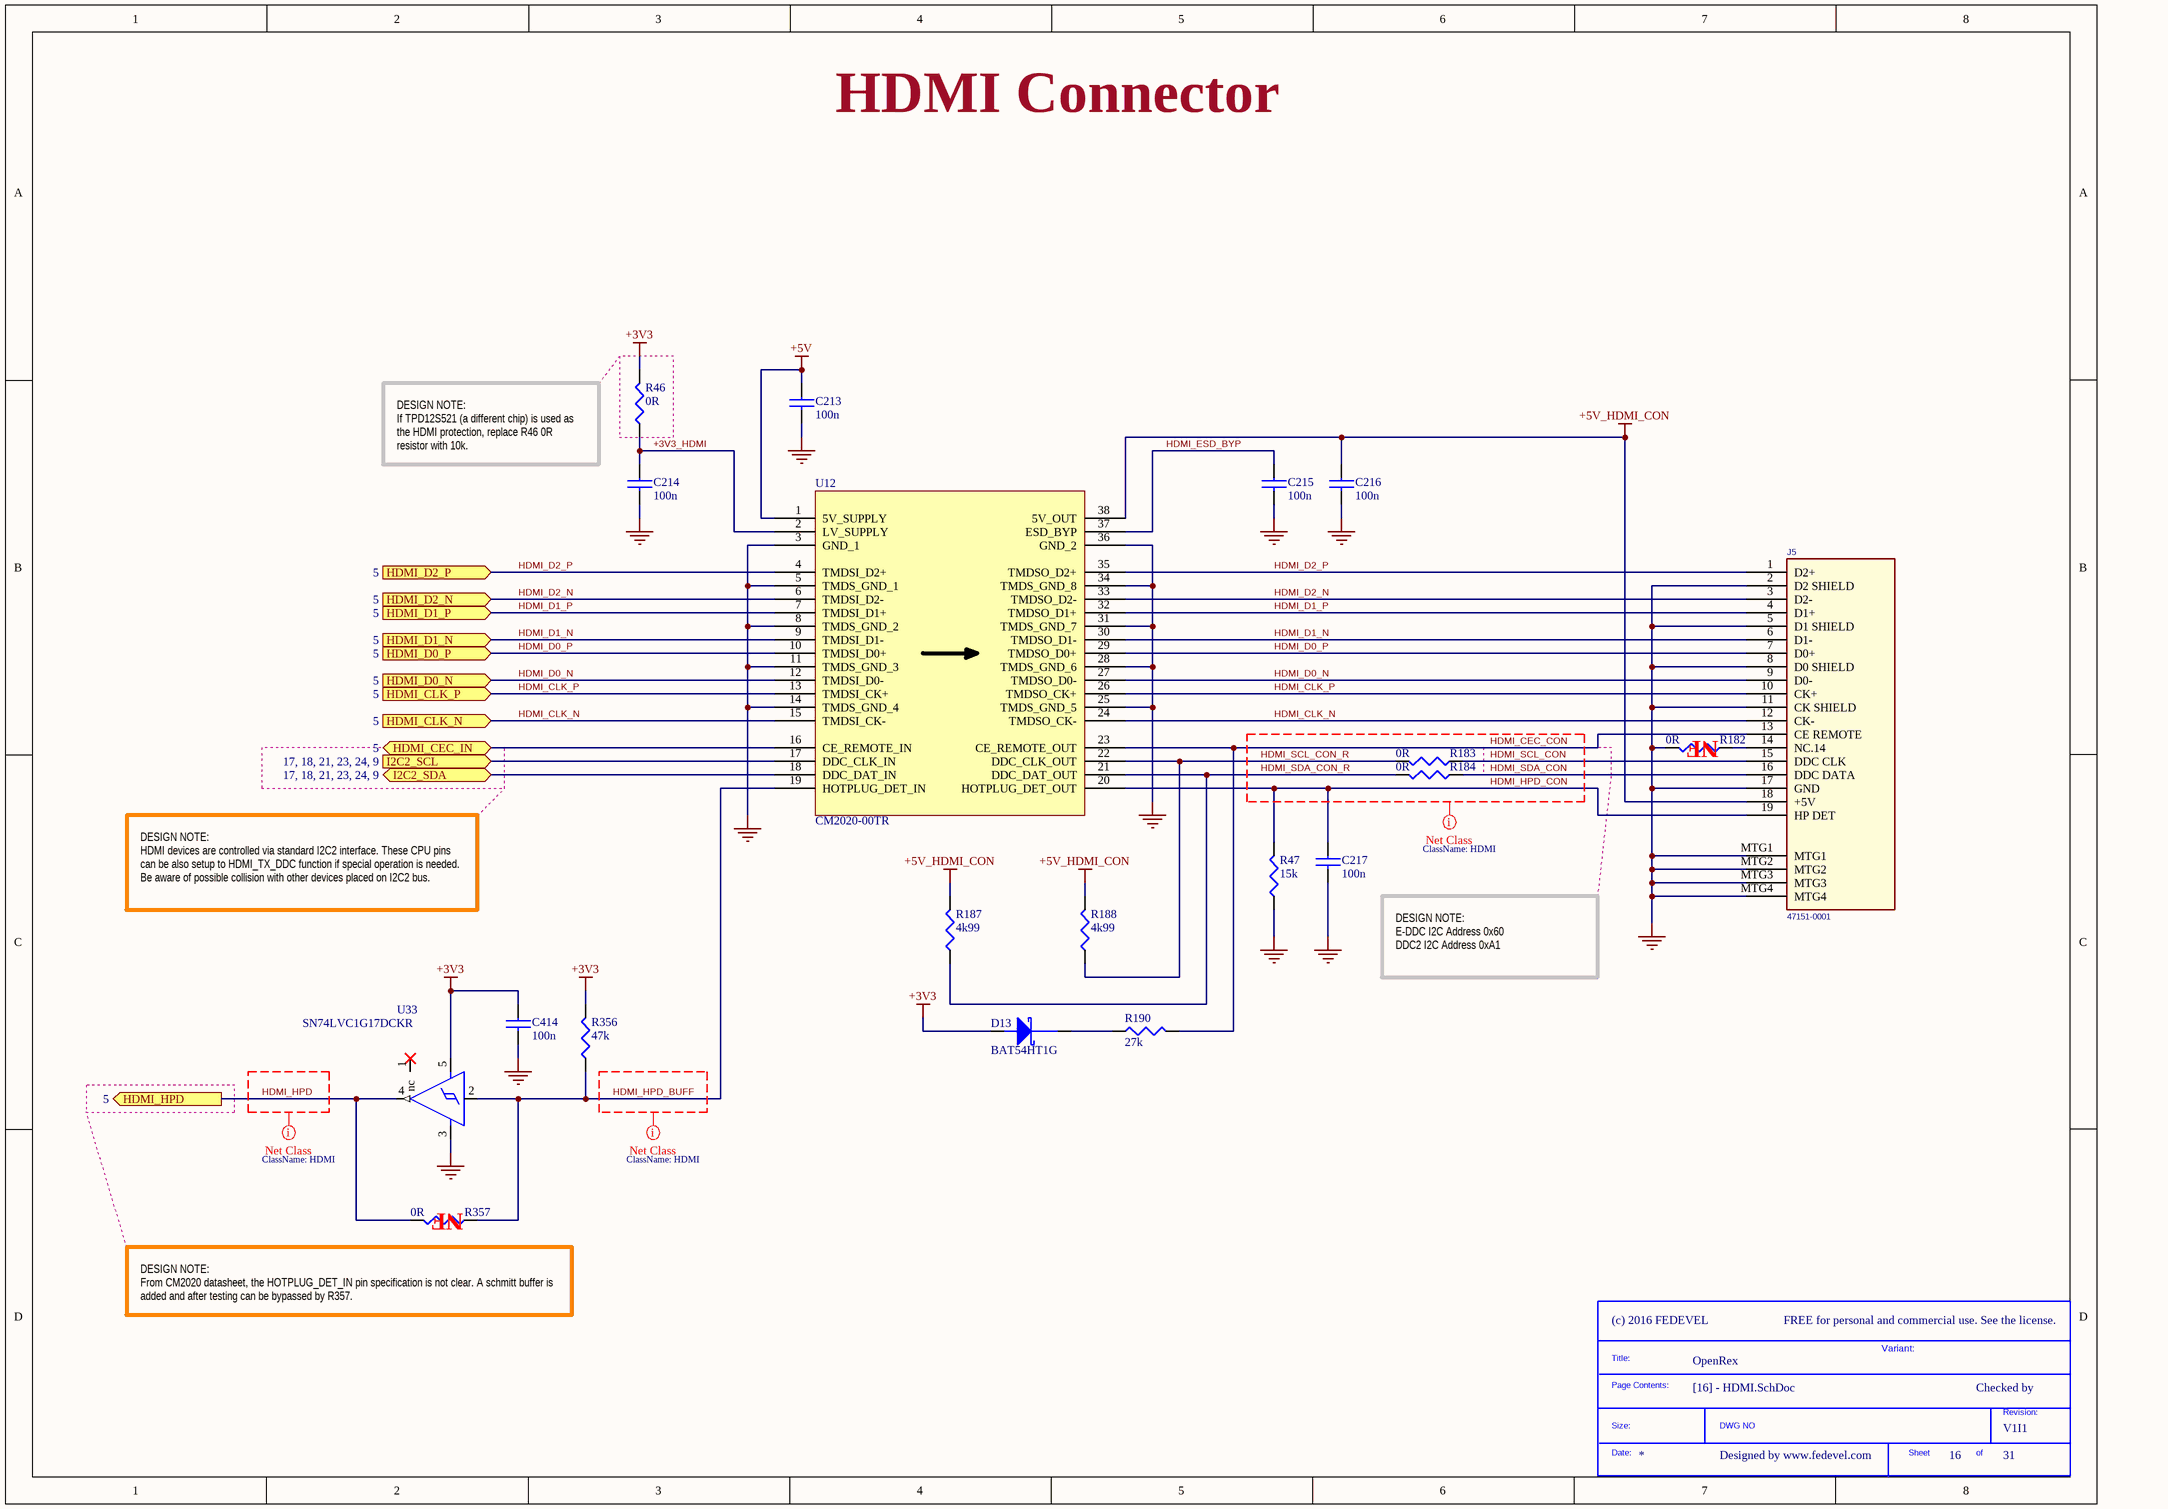
[diagram p47: [16] - HDMI.SchDoc]

### Parts
(Parts that share a designator on the sheet are numbered #1, #2 ... from top to bottom, then left to right.)
*#28  SDTitleBlock  (value not drawn)  (graphical)
C213  100n  [C0402]
C214  100n  [C0402]
C215  100n  [C0402]
C216  100n  [C0402]
C217  100n  [C0402]
C414  100n  [C0402]
D13  BAT54HT1G  [SOD323]
J5  47151-0001  [HDMI V1.1]
R46  0R  [R0402]
R47  15k  [R0402]
R182  0R  [R0402]
R183  0R  [R0402]
R184  0R  [R0402]
R187  4k99  [R0402]
R188  4k99  [R0402]
R190  27k  [R0402]
R356  47k  [R0402]
R357  0R  [R0402]
U12  CM2020-00TR  [TSSOP_38]
U33  SN74LVC1G17DCKR  [SC70_5]

### Ports
HDMI_CEC_IN (bidir, see 5), HDMI_CLK_N (in, see 5), HDMI_CLK_P (in, see 5), HDMI_D0_N (in, see 5), HDMI_D0_P (in, see 5), HDMI_D1_N (in, see 5), HDMI_D1_P (in, see 5), HDMI_D2_N (in, see 5), HDMI_D2_P (in, see 5), HDMI_HPD (out, see 5), I2C2_SCL (see 17, 18, 21, 23, 24, 9), I2C2_SDA (bidir, see 17, 18, 21, 23, 24, 9)

### Nets
+3V3: C414.1 D13.2(Anode) R46.2 R356.2 U33.5(NC1)
+5V: C213.1 U12.1(5V_SUPPLY)
+5V_HDMI_CON: C216.1 J5.18(+5V) R187.2 R188.2 U12.38(5V_OUT)
GND: C213.2 C214.2 C215.2 C216.2 C217.2 C414.2 J5.2(D2_SHIELD) J5.5(D1_SHIELD) J5.8(D0_SHIELD) J5.11(CK_SHIELD) J5.17(GND) J5.MTG1 J5.MTG2 J5.MTG3 J5.MTG4 R47.1 R182.2 U12.3(GND_1) U12.5(TMDS_GND_1) U12.8(TMDS_GND_2) U12.11(TMDS_GND_3) U12.14(TMDS_GND_4) U12.25(TMDS_GND_5) U12.28(TMDS_GND_6) U12.31(TMDS_GND_7) U12.34(TMDS_GND_8) U12.36(GND_2) U33.3(GND)
+3V3_HDMI: C214.1 R46.1 U12.2(LV_SUPPLY)
HDMI_CEC_CON: J5.13(CE_REMOTE) R190.2 U12.23(CE_REMOTE_OUT)
HDMI_CEC_IN: U12.16(CE_REMOTE_IN) ; port HDMI_CEC_IN
HDMI_CLK_N: J5.12(CK-) U12.15(TMDSI_CK-) U12.24(TMDSO_CK-) ; port HDMI_CLK_N
HDMI_CLK_P: J5.10(CK+) U12.13(TMDSI_CK+) U12.26(TMDSO_CK+) ; port HDMI_CLK_P
HDMI_D0_N: J5.9(D0-) U12.12(TMDSI_D0-) U12.27(TMDSO_D0-) ; port HDMI_D0_N
HDMI_D0_P: J5.7(D0+) U12.10(TMDSI_D0+) U12.29(TMDSO_D0+) ; port HDMI_D0_P
HDMI_D1_N: J5.6(D1-) U12.9(TMDSI_D1-) U12.30(TMDSO_D1-) ; port HDMI_D1_N
HDMI_D1_P: J5.4(D1+) U12.7(TMDSI_D1+) U12.32(TMDSO_D1+) ; port HDMI_D1_P
HDMI_D2_N: J5.3(D2-) U12.6(TMDSI_D2-) U12.33(TMDSO_D2-) ; port HDMI_D2_N
HDMI_D2_P: J5.1(D2+) U12.4(TMDSI_D2+) U12.35(TMDSO_D2+) ; port HDMI_D2_P
HDMI_ESD_BYP: C215.1 U12.37(ESD_BYP)
HDMI_HPD: R357.2 U33.4(O) ; port HDMI_HPD
HDMI_HPD_BUFF: R356.1 R357.1 U12.19(HOTPLUG_DET_IN) U33.2(I)
HDMI_HPD_CON: C217.1 J5.19(HP_DET) R47.2 U12.20(HOTPLUG_DET_OUT)
HDMI_SCL_CON: J5.15(DDC_CLK) R183.1
HDMI_SCL_CON_R: R183.2 R188.1 U12.22(DDC_CLK_OUT)
HDMI_SDA_CON: J5.16(DDC_DATA) R184.1
HDMI_SDA_CON_R: R184.2 R187.1 U12.21(DDC_DAT_OUT)
I2C2_SCL: U12.17(DDC_CLK_IN) ; port I2C2_SCL
I2C2_SDA: U12.18(DDC_DAT_IN) ; port I2C2_SDA
NetD13_1: D13.1(Cathode) R190.1
NetJ5_14: J5.14(NC.14) R182.1

Not connected (* = marked no-connect by the designer): U33 1(nc)*

### Layout directives
net class HDMI: HDMI_CEC_CON, HDMI_HPD, HDMI_HPD_BUFF, HDMI_HPD_CON, HDMI_SCL_CON, HDMI_SCL_CON_R, HDMI_SDA_CON, HDMI_SDA_CON_R

### Notes on the sheet
- HDMI Connector
- DESIGN NOTE:
  If TPD12S521 (a different chip) is used as the HDMI protection, replace R46 0R resistor with 10k.
- DESIGN NOTE:
  HDMI devices are controlled via standard I2C2 interface. These CPU pins can be also setup to HDMI_TX_DDC function if special operation is needed. Be aware of possible collision with other devices placed on I2C2 bus.
- DESIGN NOTE:
  E-DDC I2C Address 0x60
  DDC2 I2C Address 0xA1
- (near R357) DESIGN NOTE:
  From CM2020 datasheet, the HOTPLUG_DET_IN pin specification is not clear. A schmitt buffer is added and after testing can be bypassed by R357.
- FREE for personal and commercial use. See the license.
- Variant:
- Checked by
- Designed by www.fedevel.com
- (in symbol SDTitleBlock) Title:; Page Contents:; Revision:; Size:; DWG NO; Date:; Sheet; of

### Library data of the parts
C213-C217 C414 = C1005X5R1H104K: as C230 on sheet [28] - PWR IN, MECH, DOC; Category: Capacitors; Supplier Part Number: 445-5942-1-ND; Manufacturer Part Number: C1005X5R1H104K; Operating Temperature: -55°C ~ 85°C; Package / Case: 0402 (1005 Metric); Price 1k [$]: 0.02340; .Checked SCH: used; Voltage - Rated: 50V; Supplier: Digikey; Supplier 1: Digi-Key; Supplier Part Number 1: 445-5942-1-ND; RoHS: RoHS Compliant; Stock 1: 106926; Pricing 1: 1=0.27, 10=0.18, 100=0.072, 250=0.05176, 500=0.0369, 1000=0.027 (USD); Tolerance: ±10%; Temperature Coefficient: X5R; Mounting Type: Surface Mount, MLCC; Applications: General Purpose; Ratings: -; Size / Dimension: 0.039" L x 0.020" W (1.00mm x 0.50mm); Height - Seated (Max): -; Thickness (Max): 0.022" (0.55mm); Lead Spacing: -; Features: -; Packaging: Cut Tape (CT); Lead Style: -; ComponentLink1URL: http://www.tdk.co.jp/tefe02/e412_c.pdf; ComponentLink1Description: http://www.tdk.co.jp/tefe02/e412_c.pdf
D13 = BAT54HT1G: DIODE SCHOTTKY 30V 0.2A SOD323; Manufacturer: Fairchild Semiconductor; Current - Average Rectified (Io): 200mA; Voltage - Forward (Vf) (Max) @ If: 800mV @ 100mA; Speed: Small Signal =< 200mA (Io), Any Speed; Reverse Recovery Time (trr): 5ns; Current - Reverse Leakage @ Vr: 2µA @ 25V; Capacitance @ Vr, F: 10pF @ 1V, 1MHz; Thermal Resistance: 600°C/W Ja; .Creator: MM; .Checked PCB: used; Supplier 1: Digi-Key; Manufacturer Part Number: BAT54HT1G; RoHS: RoHS Compliant; Category: Discrete Semiconductor Products; Stock 1: 11388; Pricing 1: 1=0.3, 10=0.276, 25=0.1984, 100=0.1543, 250=0.09696, 500=0.0826, 1000=0.05628 (USD); Packaging: Cut Tape (CT); Diode Type: Schottky; Voltage - DC Reverse (Vr) (Max): 30V; Mounting Type: Surface Mount; Package / Case: SC-76, SOD-323; Supplier Device Package: SOD-323; Operating Temperature - Junction: -55°C ~ 150°C; ComponentLink1URL: http://www.fairchildsemi.com/ds/BA/BAT54HT1G.pdf; ComponentLink1Description: http://www.fairchildsemi.com/ds/BA/BAT54HT1G.pdf; Supplier Part Number 1: BAT54HT1GCT-ND; .Checked SCH: used
J5 = 47151-0001_v1.1: CONN RCPT 19POS HDMI RT ANG SMD; Manufacturer: Molex Connector Corporation; .Checked PCB: MM; Number of Positions: 19; Pitch: 0.50mm (.020"); Gender: Receptacle; .Version: V1.1 - Changed holes to slots; .Checked SCH: MM; Category: Connectors, Interconnects; Connector Type: HDMI; Family: USB, IEEE-1394 (Firewire), DVI, HDMI; Manufacturer Part Number: 47151-0001; Operating Temperature: -20°C to +85°C; Price 1k [$]: 1.74610; Supplier: Digikey; Supplier Part Number: WM19086CT-ND; Value: 47151-0001; Supplier 1: Digi-Key; Supplier Part Number 1: WM19086CT-ND; RoHS: RoHS Compliant; Stock 1: 2756; Pricing 1: 1=3.1, 10=2.57, 50=2.1456, 100=1.9034 (USD); Number of Contacts: 19; Specifications: -; Mounting Type: Surface Mount, Right Angle, Horizontal; Features: Detent Lock; Packaging: Cut Tape (CT); Ingress Protection: -; ComponentLink1URL: http://www.molex.com/pdm_docs/sd/471510001_sd.pdf; ComponentLink1Description: http://www.molex.com/pdm_docs/sd/471510001_sd.pdf
R46 R182-R184 R357 = RC0402JR-070RL: as R155 on sheet [28] - PWR IN, MECH, DOC; Category: Resistors; Manufacturer Part Number: RC0402JR-070RL; Package / Case: 0402 (1005 Metric); Price 1k [$]: 0.01389; Value: 0R; .Checked SCH: used; Supplier Part Number: 311-0.0JRCT-ND; Supplier: Digikey; Supplier 1: Digi-Key; Supplier Part Number 1: 311-0.0JRCT-ND; RoHS: RoHS Compliant; Stock 1: 1106330; Pricing 1: 10=0.012, 50=0.009, 100=0.0069, 250=0.00512, 500=0.0038, 1000=0.00253 (USD); Composition: Thick Film; Features: -; Temperature Coefficient: -; Size / Dimension: 0.039" L x 0.020" W (1.00mm x 0.50mm); Height: 0.016" (0.40mm); Number of Terminations: 2; Packaging: Cut Tape (CT); ComponentLink1URL: http://www.yageo.com/documents/recent/PYu-RC0402_51_RoHS_L_6.pdf; ComponentLink1Description: http://www.yageo.com/documents/recent/PYu-RC0402_51_RoHS_L_6.pdf
R47 = RC0402FR-0715KL: RES 15.0K OHM 1/16W 1% 0402 SMD; Manufacturer: Yageo; Power (Watts): 0.063W, 1/16W; .Checked PCB: used; Temperature Coefficient: ±100ppm/°C; Category: Resistors; Supplier Part Number: 311-15.0KLRCT-ND; Manufacturer Part Number: RC0402FR-0715KL; Package / Case: 0402 (1005 Metric); Price 1k [$]: 0.01421; Resistance (Ohms): 15K; Tolerance: ±1%; Value: 15k; .Checked SCH: used; Supplier: Digikey; Supplier 1: Digi-Key; Supplier Part Number 1: 311-15.0KLRCT-ND; RoHS: RoHS Compliant; Stock 1: 31992; Pricing 1: 10=0.014, 50=0.0104, 100=0.0079, 250=0.00584, 500=0.00432, 1000=0.00288 (USD); Composition: Thick Film; Features: -; Size / Dimension: 0.039" L x 0.020" W (1.00mm x 0.50mm); Height: 0.016" (0.40mm); Number of Terminations: 2; Packaging: Cut Tape (CT); ComponentLink1URL: http://www.yageo.com/documents/recent/PYu-RC0402_51_RoHS_L_6.pdf; ComponentLink1Description: http://www.yageo.com/documents/recent/PYu-RC0402_51_RoHS_L_6.pdf
R187 R188 = RMCF0402FT4K99: RES TF 4.99K OHM 1% 1/16W 0402; Manufacturer: Stackpole Electronics Inc; Power (Watts): 0.063W, 1/16W; .Checked PCB: used; Temperature Coefficient: ±100ppm/°C; Category: Resistors; Supplier Part Number: RMCF0402FT4K99CT-ND; Manufacturer Part Number: RMCF0402FT4K99; Package / Case: 0402 (1005 Metric); Price 1k [$]: 0.00384; Resistance (Ohms): 4.99K; Tolerance: ±1%; Value: 4k99; .Checked SCH: used; Supplier: Digikey; Supplier 1: Digi-Key; Supplier Part Number 1: RMCF0402FT4K99CT-ND; RoHS: RoHS Compliant; Stock 1: 48509; Pricing 1: 1=0.04, 10=0.025, 50=0.0138, 100=0.0105, 250=0.0078, 500=0.00576, 1000=0.00384 (USD); Composition: Thick Film; Features: -; Size / Dimension: 0.039" L x 0.020" W (1.00mm x 0.50mm); Height: 0.016" (0.40mm); Number of Terminations: 2; Packaging: Cut Tape (CT); ComponentLink1URL: http://www.seielect.com/Catalog/SEI-RMCF.pdf; ComponentLink1Description: http://www.seielect.com/Catalog/SEI-RMCF.pdf
R190 = RC0402FR-0727KL: RES 27.0K OHM 1/16W 1% 0402 SMD; Manufacturer: Yageo; Power (Watts): 0.063W, 1/16W; .Checked PCB: used; Temperature Coefficient: ±100ppm/°C; Category: Resistors; Supplier Part Number: 311-27.0KLRCT-ND; Manufacturer Part Number: RC0402FR-0727KL; Package / Case: 0402 (1005 Metric); Price 1k [$]: 0.00288; Resistance (Ohms): 27K; Tolerance: ±1%; Value: 27k; .Checked SCH: used; Supplier: Digikey; Supplier 1: Digi-Key; Supplier Part Number 1: 311-27.0KLRCT-ND; RoHS: RoHS Compliant; Stock 1: 21638; Pricing 1: 10=0.014, 50=0.0104, 100=0.0079, 250=0.00584, 500=0.00432, 1000=0.00288 (USD); Composition: Thick Film; Features: -; Size / Dimension: 0.039" L x 0.020" W (1.00mm x 0.50mm); Height: 0.016" (0.40mm); Number of Terminations: 2; Packaging: Cut Tape (CT); ComponentLink1URL: http://www.yageo.com/documents/recent/PYu-RC0402_51_RoHS_L_6.pdf; ComponentLink1Description: http://www.yageo.com/documents/recent/PYu-RC0402_51_RoHS_L_6.pdf
R356 = RC0402FR-0747KL: RES 47.0K OHM 1/16W 1% 0402 SMD; Manufacturer: Yageo; Power (Watts): 0.063W, 1/16W; .Checked PCB: used; Temperature Coefficient: ±100ppm/°C; Category: Resistors; Supplier Part Number: 311-47.0KLRCT-ND; Manufacturer Part Number: RC0402FR-0747KL; Package / Case: 0402 (1005 Metric); Price 1k [$]: 0.01421; Resistance (Ohms): 47K; Tolerance: ±1%; Value: 47k; .Checked SCH: used; Supplier: Digikey; Supplier 1: Digi-Key; Supplier Part Number 1: 311-47.0KLRCT-ND; RoHS: RoHS Compliant; Stock 1: 1227580; Pricing 1: 10=0.014, 50=0.0104, 100=0.0079, 250=0.00584, 500=0.00432, 1000=0.00288 (USD); Composition: Thick Film; Features: -; Size / Dimension: 0.039" L x 0.020" W (1.00mm x 0.50mm); Height: 0.016" (0.40mm); Number of Terminations: 2; Packaging: Cut Tape (CT); ComponentLink1URL: http://www.yageo.com/documents/recent/PYu-RC0402_51_RoHS_L_6.pdf; ComponentLink1Description: http://www.yageo.com/documents/recent/PYu-RC0402_51_RoHS_L_6.pdf
U12 = CM2020-00TR: IC HDMI TX PORT P/I 38-TSSOP; Manufacturer: ON Semiconductor; .Creator: MM; .Checked PCB: used; Supplier 1: Digi-Key; Manufacturer Part Number: CM2020-00TR; RoHS: RoHS Compliant; Category: Integrated Circuits (ICs); Stock 1: 7580; Pricing 1: 1=1.52, 10=1.34, 25=1.2096, 100=1.0584, 250=0.9282, 500=0.8232, 1000=0.651 (USD); Packaging: Cut Tape (CT); Type: HDMI Transmitter; Applications: Consumer Electronics, DVD-RW Players, Set Top Box; Mounting Type: Surface Mount; Package / Case: 38-TFSOP (0.173", 4.40mm Width) Exposed Pad; Supplier Device Package: 38-TSSOP; ComponentLink1URL: http://www.onsemi.com/pub_link/Collateral/CM2020-00TR-D.PDF; ComponentLink1Description: http://www.onsemi.com/pub_link/Collateral/CM2020-00TR-D.PDF; Supplier Part Number 1: CM2020-00TROSCT-ND; .Checked SCH: used
U33 = SN74LVC1G17DCKR: IC BUFFER SCHMIT TRIG SC705; Manufacturer: Texas Instruments; Logic Type: Schmitt Trigger - Buffer, Driver; Number of Elements: 1; Current - Output High, Low: 32mA, 32mA; Voltage - Supply: 1.65 V ~ 5.5 V; .Checked PCB: RF; Supplier 1: Digi-Key; Supplier Part Number 1: 296-11934-1-ND; Manufacturer Part Number: SN74LVC1G17DCKR; RoHS: RoHS Compliant; Category: Integrated Circuits (ICs); Stock 1: 50549; Pricing 1: 1=0.12, 10=0.097, 25=0.086, 100=0.0581, 250=0.05696, 500=0.0559, 750=0.05483 (USD); Number of Bits per Element: 1; Operating Temperature: -40°C ~ 85°C; Mounting Type: Surface Mount; Package / Case: 6-TSSOP (5 Lead), SC-88A, SOT-353; Supplier Device Package: SC-70-5; Packaging: Cut Tape (CT); ComponentLink1URL: http://www.ti.com/lit/ds/symlink/sn74lvc1g17.pdf; ComponentLink1Description: http://www.ti.com/lit/ds/symlink/sn74lvc1g17.pdf; .Checked SCH: RF